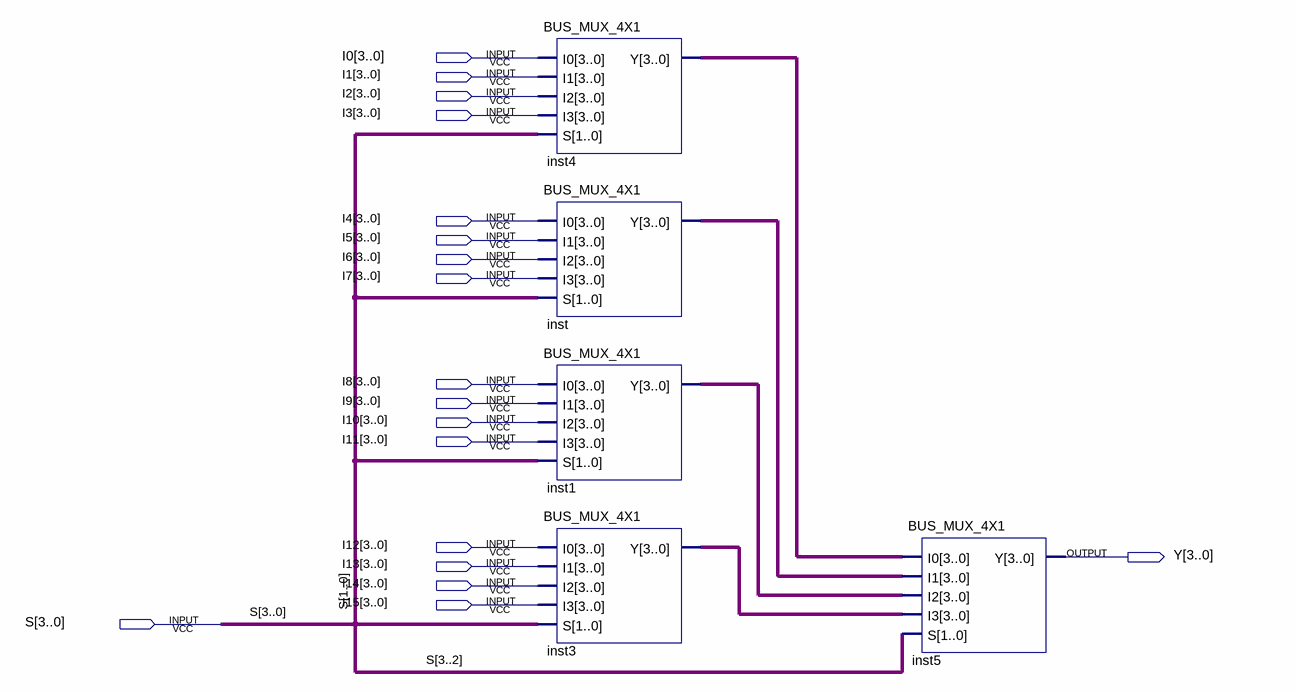
[diagram p0: schematic sheet]
// Quartus schematic BUS_MUX_16X1.bdf as structural Verilog: 5 symbols, 18 pins
module BUS_MUX_16X1 (
  input  [3:0] I0,
  input  [3:0] I1,
  input  [3:0] I2,
  input  [3:0] I3,
  input  [3:0] I4,
  input  [3:0] I5,
  input  [3:0] I6,
  input  [3:0] I7,
  input  [3:0] I8,
  input  [3:0] I9,
  input  [3:0] I10,
  input  [3:0] I11,
  input  [3:0] I12,
  input  [3:0] I13,
  input  [3:0] I14,
  input  [3:0] I15,
  input  [3:0] S,
  output [3:0] Y
);

  wire [3:0] inst1_y, inst3_y, inst4_y, inst_y;

  BUS_MUX_4X1 inst4 (.I0(I0), .I1(I1), .I2(I2), .I3(I3), .S(S[1:0]), .Y(inst4_y));
  BUS_MUX_4X1 inst (.I0(I4), .I1(I5), .I2(I6), .I3(I7), .S(S[1:0]), .Y(inst_y));
  BUS_MUX_4X1 inst1 (.I0(I8), .I1(I9), .I2(I10), .I3(I11), .S(S[1:0]), .Y(inst1_y));
  BUS_MUX_4X1 inst3 (.I0(I12), .I1(I13), .I2(I14), .I3(I15), .S(S), .Y(inst3_y));
  BUS_MUX_4X1 inst5 (.I0(inst4_y), .I1(inst_y), .I2(inst1_y), .I3(inst3_y), .S(S[3:2]), .Y(Y));
endmodule
